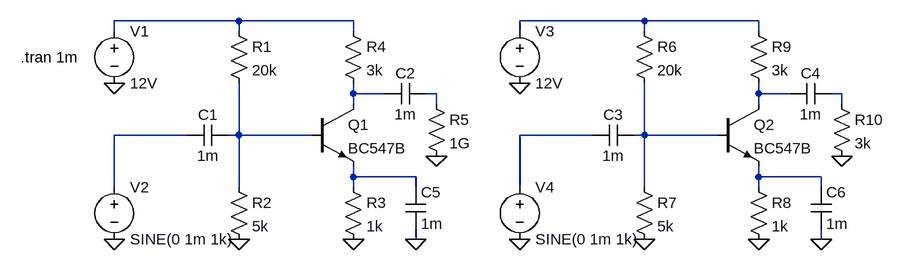
[diagram p0: schematic em.asc]
em.asc, the LTspice schematic file:
Version 4
SHEET 1 1016 680
WIRE 16 -16 -176 -16
WIRE 192 -16 16 -16
WIRE 640 -16 448 -16
WIRE 816 -16 640 -16
WIRE -176 0 -176 -16
WIRE 16 0 16 -16
WIRE 192 0 192 -16
WIRE 448 0 448 -16
WIRE 640 0 640 -16
WIRE 816 0 816 -16
WIRE 192 96 192 80
WIRE 240 96 192 96
WIRE 320 96 304 96
WIRE 816 96 816 80
WIRE 864 96 816 96
WIRE 944 96 928 96
WIRE 192 112 192 96
WIRE 320 112 320 96
WIRE 816 112 816 96
WIRE 944 112 944 96
WIRE -64 160 -176 160
WIRE 16 160 16 80
WIRE 16 160 0 160
WIRE 128 160 16 160
WIRE 560 160 448 160
WIRE 640 160 640 80
WIRE 640 160 624 160
WIRE 752 160 640 160
WIRE 192 224 192 208
WIRE 288 224 192 224
WIRE 816 224 816 208
WIRE 912 224 816 224
WIRE -176 240 -176 160
WIRE 16 240 16 160
WIRE 192 240 192 224
WIRE 288 240 288 224
WIRE 448 240 448 160
WIRE 640 240 640 160
WIRE 816 240 816 224
WIRE 912 240 912 224
WIRE 288 320 288 304
WIRE 912 320 912 304
FLAG 16 320 0
FLAG 192 320 0
FLAG -176 80 0
FLAG -176 320 0
FLAG 320 192 0
FLAG 288 320 0
FLAG 640 320 0
FLAG 816 320 0
FLAG 448 80 0
FLAG 448 320 0
FLAG 944 192 0
FLAG 912 320 0
SYMBOL npn 128 112 R0
SYMATTR InstName Q1
SYMATTR Value BC547B
SYMBOL res 0 -16 R0
SYMATTR InstName R1
SYMATTR Value 20k
SYMBOL res 0 224 R0
SYMATTR InstName R2
SYMATTR Value 5k
SYMBOL res 176 224 R0
SYMATTR InstName R3
SYMATTR Value 1k
SYMBOL res 176 -16 R0
SYMATTR InstName R4
SYMATTR Value 3k
SYMBOL voltage -176 -16 R0
WINDOW 123 0 0 Left 2
WINDOW 39 0 0 Left 2
SYMATTR InstName V1
SYMATTR Value 12V
SYMBOL cap 0 144 R90
WINDOW 0 0 32 VBottom 2
WINDOW 3 32 32 VTop 2
SYMATTR InstName C1
SYMATTR Value 1m
SYMBOL voltage -176 224 R0
WINDOW 123 0 0 Left 2
WINDOW 39 0 0 Left 2
SYMATTR InstName V2
SYMATTR Value SINE(0 1m 1k)
SYMBOL cap 304 80 R90
WINDOW 0 0 32 VBottom 2
WINDOW 3 32 32 VTop 2
SYMATTR InstName C2
SYMATTR Value 1m
SYMBOL res 304 96 R0
SYMATTR InstName R5
SYMATTR Value 1G
SYMBOL cap 272 240 R0
SYMATTR InstName C5
SYMATTR Value 1m
SYMBOL npn 752 112 R0
SYMATTR InstName Q2
SYMATTR Value BC547B
SYMBOL res 624 -16 R0
SYMATTR InstName R6
SYMATTR Value 20k
SYMBOL res 624 224 R0
SYMATTR InstName R7
SYMATTR Value 5k
SYMBOL res 800 224 R0
SYMATTR InstName R8
SYMATTR Value 1k
SYMBOL res 800 -16 R0
SYMATTR InstName R9
SYMATTR Value 3k
SYMBOL voltage 448 -16 R0
WINDOW 123 0 0 Left 2
WINDOW 39 0 0 Left 2
SYMATTR InstName V3
SYMATTR Value 12V
SYMBOL cap 624 144 R90
WINDOW 0 0 32 VBottom 2
WINDOW 3 32 32 VTop 2
SYMATTR InstName C3
SYMATTR Value 1m
SYMBOL voltage 448 224 R0
WINDOW 123 0 0 Left 2
WINDOW 39 0 0 Left 2
SYMATTR InstName V4
SYMATTR Value SINE(0 1m 1k)
SYMBOL cap 928 80 R90
WINDOW 0 0 32 VBottom 2
WINDOW 3 32 32 VTop 2
SYMATTR InstName C4
SYMATTR Value 1m
SYMBOL res 928 96 R0
SYMATTR InstName R10
SYMATTR Value 3k
SYMBOL cap 896 240 R0
SYMATTR InstName C6
SYMATTR Value 1m
TEXT -320 40 Left 2 !.tran 1m

The netlist it stands for:
* em.asc
Q1 N003 N008 N011 0 BC547B
R1 N001 N008 20k
R2 N008 0 5k
R3 N011 0 1k
R4 N001 N003 3k
V1 N001 0 12V
C1 N008 N007 1m
V2 N007 0 SINE(0 1m 1k)
C2 N004 N003 1m
R5 N004 0 1G
C5 N011 0 1m
Q2 N005 N010 N012 0 BC547B
R6 N002 N010 20k
R7 N010 0 5k
R8 N012 0 1k
R9 N002 N005 3k
V3 N002 0 12V
C3 N010 N009 1m
V4 N009 0 SINE(0 1m 1k)
C4 N006 N005 1m
R10 N006 0 3k
C6 N012 0 1m
.model NPN NPN
.model PNP PNP
.lib standard.bjt
.tran 1m
.backanno
.end